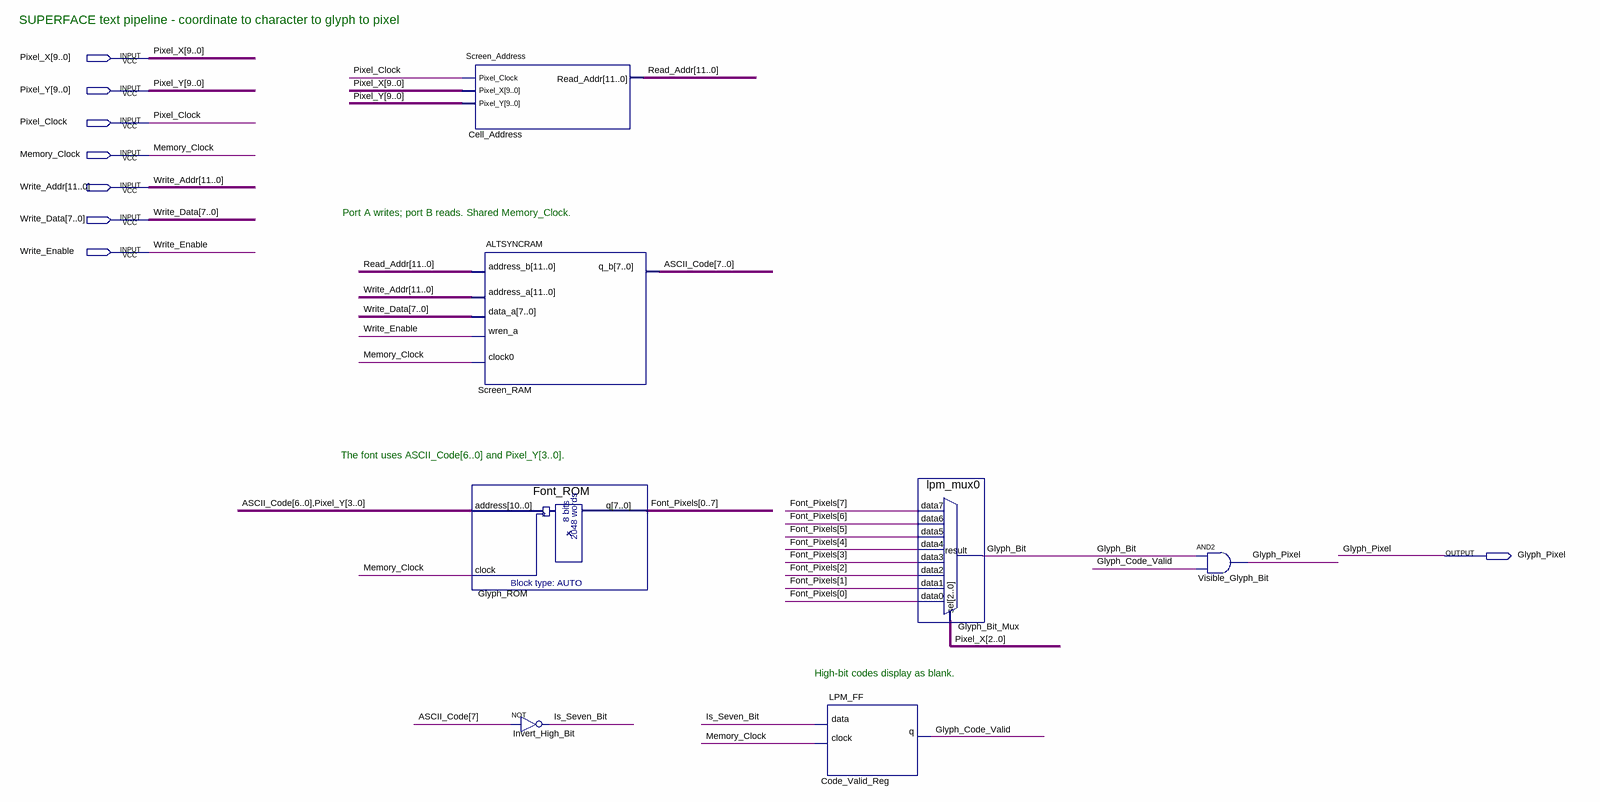
[diagram p0: schematic sheet]
// Quartus schematic Text_Renderer.bdf as structural Verilog: 7 symbols, 8 pins
module Text_Renderer (
  input  [9:0] Pixel_X,
  input  [9:0] Pixel_Y,
  input  Pixel_Clock,
  input  Memory_Clock,
  input  [11:0] Write_Addr,
  input  [7:0] Write_Data,
  input  Write_Enable,
  output Glyph_Pixel
);

  wire Glyph_Bit, Glyph_Code_Valid, Is_Seven_Bit;
  wire [7:0] ASCII_Code, Font_Pixels;
  wire [11:0] Read_Addr;

  Screen_Address Cell_Address (.Pixel_Clock(Pixel_Clock), .Pixel_X(Pixel_X), .Pixel_Y(Pixel_Y), .Read_Addr(Read_Addr));
  ALTSYNCRAM #(.OPERATION_MODE("DUAL_PORT"), .RAM_BLOCK_TYPE("M4K"), .WIDTH_A(8), .WIDTH_B(8), .WIDTHAD_A(12), .WIDTHAD_B(12), .NUMWORDS_A(2400), .NUMWORDS_B(2400), .ADDRESS_REG_B("CLOCK0"), .OUTDATA_REG_B("UNREGISTERED"), .READ_DURING_WRITE_MODE_MIXED_PORTS("OLD_DATA"), .INIT_FILE("superface_screen.mif")) Screen_RAM (
    .address_b(Read_Addr), .address_a(Write_Addr), .data_a(Write_Data), .wren_a(Write_Enable),
    .clock0(Memory_Clock), .q_b(ASCII_Code));
  Font_ROM Glyph_ROM (
    .address({ASCII_Code[6:0], Pixel_Y[3:0]}), .clock(Memory_Clock),
    .q({Font_Pixels[0], Font_Pixels[1], Font_Pixels[2], Font_Pixels[3], Font_Pixels[4], Font_Pixels[5], Font_Pixels[6], Font_Pixels[7]}));
  not Invert_High_Bit (Is_Seven_Bit, ASCII_Code[7]);
  LPM_FF #(.LPM_WIDTH(1), .LPM_FFTYPE("DFF")) Code_Valid_Reg (
    .data(Is_Seven_Bit), .clock(Memory_Clock), .q(Glyph_Code_Valid));
  lpm_mux0 Glyph_Bit_Mux (
    .data7(Font_Pixels[7]), .data6(Font_Pixels[6]), .data5(Font_Pixels[5]), .data4(Font_Pixels[4]),
    .data3(Font_Pixels[3]), .data2(Font_Pixels[2]), .data1(Font_Pixels[1]), .data0(Font_Pixels[0]),
    .sel(Pixel_X[2:0]), .result(Glyph_Bit));
  and Visible_Glyph_Bit (Glyph_Pixel, Glyph_Bit, Glyph_Code_Valid);

  // Notes on the sheet:
  //   SUPERFACE text pipeline - coordinate to character to glyph to pixel
  //   Port A writes; port B reads. Shared Memory_Clock.
  //   The font uses ASCII_Code[6..0] and Pixel_Y[3..0].
  //   High-bit codes display as blank.
endmodule
